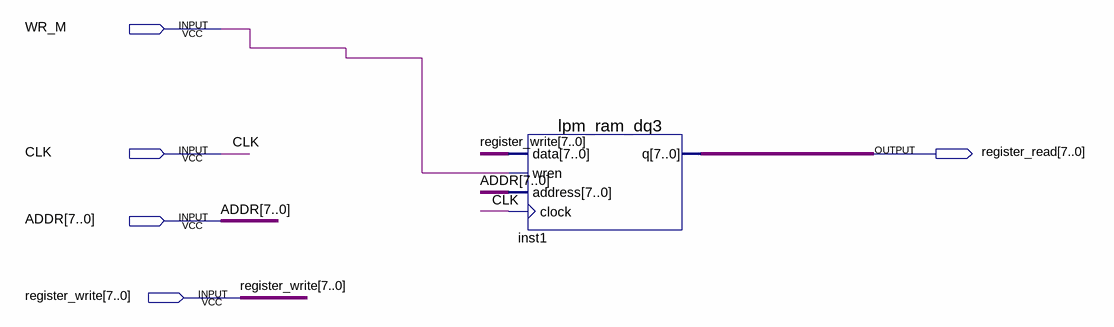
[diagram p0: schematic sheet]
// Quartus schematic DM_cpu_demp.bdf as structural Verilog: 1 symbols, 5 pins
module DM_cpu_demp (
  input  WR_M,
  input  CLK,
  input  [7:0] ADDR,
  input  [7:0] register_write,
  output [7:0] register_read
);

  lpm_ram_dq3 inst1 (.data(register_write), .wren(WR_M), .address(ADDR), .clock(CLK), .q(register_read));
endmodule
